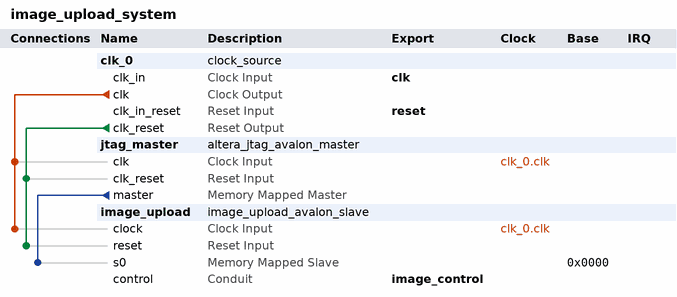
[diagram p0: system contents]
# Platform Designer (Qsys) system image_upload_system, MAX 10 10M50DAF484C7G
# Parameters at their usual value, and those the tool derives, are not listed.
package require -exact qsys 25.1
create_system image_upload_system
set_project_property DEVICE_FAMILY {MAX 10}
set_project_property DEVICE 10M50DAF484C7G

add_instance clk_0 clock_source 25.1
set_instance_parameter_value clk_0 clockFrequency 50000000

add_instance jtag_master altera_jtag_avalon_master 25.1

add_instance image_upload image_upload_avalon_slave 1.0

# connections
add_connection clk_0.clk image_upload.clock clock
add_connection clk_0.clk jtag_master.clk clock
add_connection clk_0.clk_reset image_upload.reset reset
add_connection clk_0.clk_reset jtag_master.clk_reset reset
add_connection jtag_master.master image_upload.s0 avalon
set_connection_parameter_value jtag_master.master/image_upload.s0 baseAddress 0x0000

# exported interfaces
add_interface clk clock sink
set_interface_property clk EXPORT_OF clk_0.clk_in
add_interface image_control conduit end
set_interface_property image_control EXPORT_OF image_upload.control
add_interface reset reset sink
set_interface_property reset EXPORT_OF clk_0.clk_in_reset

set_interconnect_requirement {$system} qsys_mm.clockCrossingAdapter HANDSHAKE
set_interconnect_requirement {$system} qsys_mm.enableEccProtection FALSE
set_interconnect_requirement {$system} qsys_mm.insertDefaultSlave FALSE
set_interconnect_requirement {$system} qsys_mm.maxAdditionalLatency 1

save_system image_upload_system.qsys
